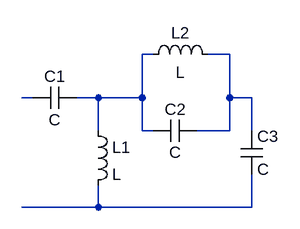
[diagram p0: schematic circuito_2.asc]
circuito_2.asc, the LTspice schematic file:
Version 4.1
SHEET 1 880 680
WIRE 240 48 224 48
WIRE 352 48 320 48
WIRE 64 112 48 112
WIRE 160 112 128 112
WIRE 224 112 224 48
WIRE 224 112 160 112
WIRE 352 112 352 48
WIRE 384 112 352 112
WIRE 160 160 160 112
WIRE 224 160 224 112
WIRE 240 160 224 160
WIRE 352 160 352 112
WIRE 352 160 304 160
WIRE 384 160 384 112
WIRE 160 272 160 240
WIRE 160 272 48 272
WIRE 384 272 384 224
WIRE 384 272 160 272
SYMBOL cap 128 96 R90
WINDOW 0 0 32 VBottom 2
WINDOW 3 32 32 VTop 2
SYMATTR InstName C1
SYMBOL ind 144 144 R0
SYMATTR InstName L1
SYMBOL ind 224 64 R270
WINDOW 0 32 56 VTop 2
WINDOW 3 5 56 VBottom 2
SYMATTR InstName L2
SYMBOL cap 304 144 R90
WINDOW 0 0 32 VBottom 2
WINDOW 3 32 32 VTop 2
SYMATTR InstName C2
SYMBOL cap 368 160 R0
SYMATTR InstName C3

The netlist it stands for:
* circuito_2.asc
C1 N001 N003 C
L1 N001 N004 L
L2 N001 N002 L
C2 N002 N001 C
C3 N002 N004 C
.backanno
.end